# Altium schematic sheet CW341_FPGAIO_1.SchDoc: Kintex IO Banks
size Letter; Organization: NewAE Technology Inc.; Address1: 1083 Queen St., Suite 196; Address2: Halifax; Address3: NS; Address4: Canada B3H 0B2; DocumentNumber: .; Revision: .; SheetNumber: 6; SheetTotal: 16; SheetApproved: YES
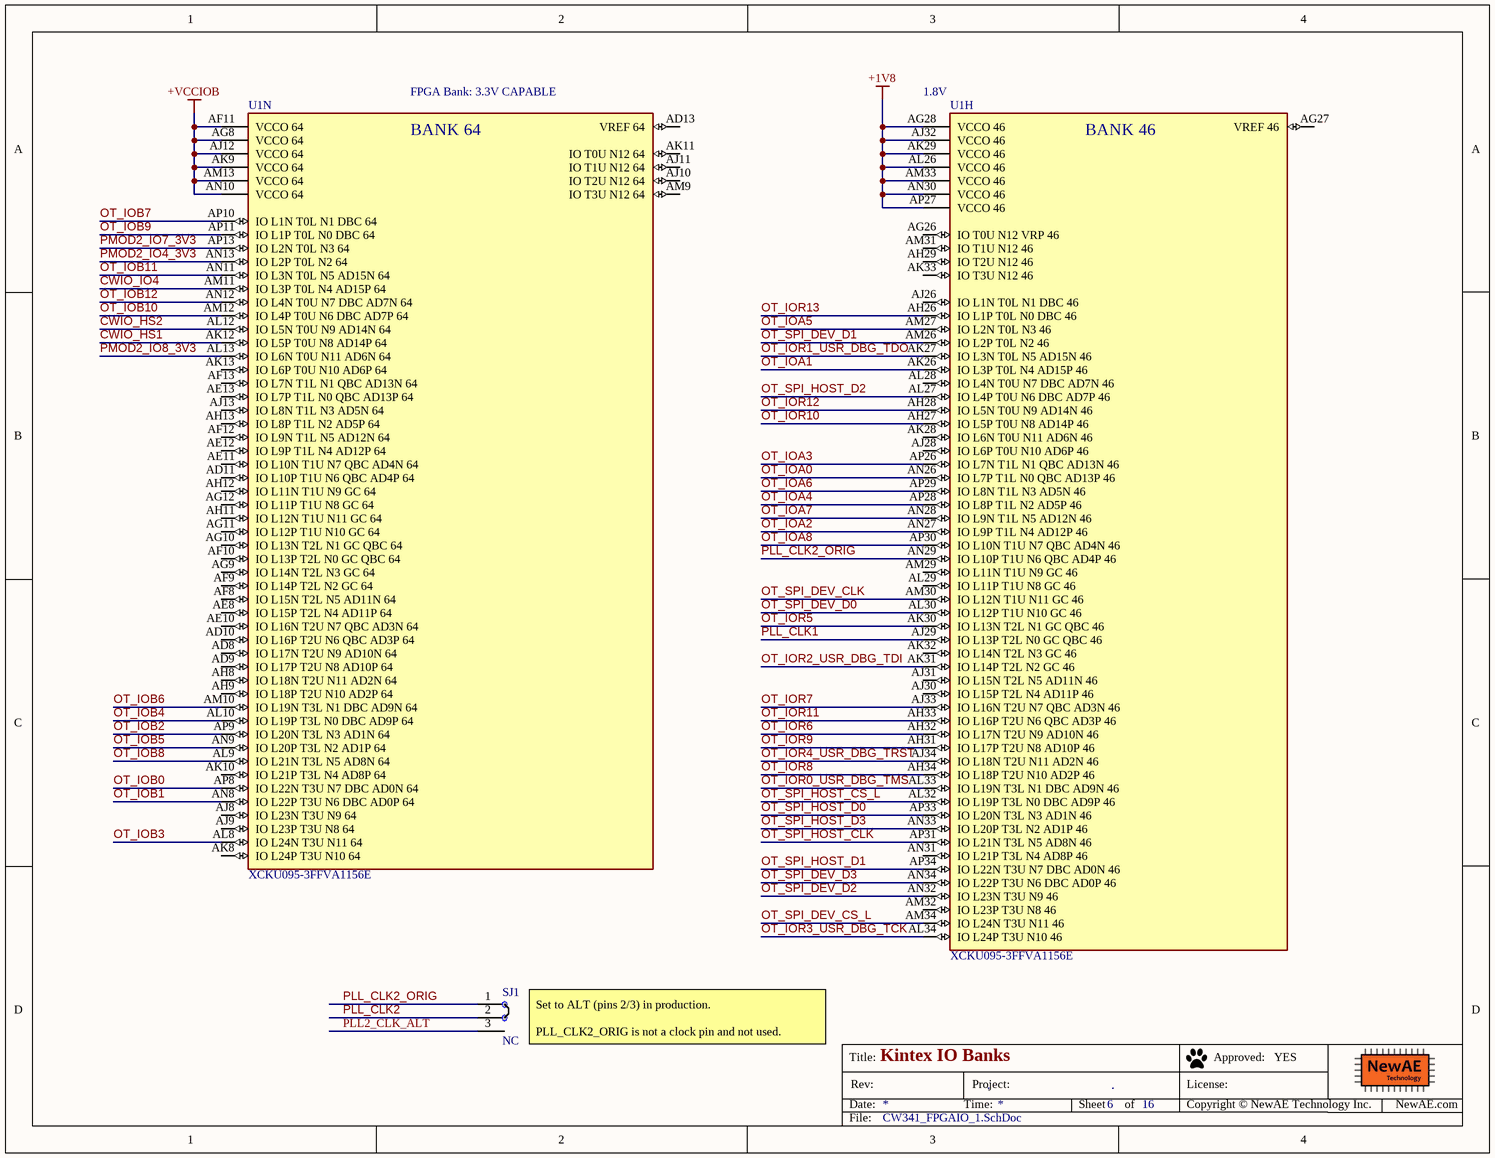
[diagram p0: CW341_FPGAIO_1.SchDoc]

## Parts
SJ1  NC  [SJ_3S_NC12]  (no BOM)
U1  XCKU095-3FFVA1156E  [FP-XCKU060-3FFVA1156E-MFG]  (parts H,N of 23)

## Nets
+1V8: U1.AG28(VCCO_46) U1.AJ32(VCCO_46) U1.AK29(VCCO_46) U1.AL26(VCCO_46) U1.AM33(VCCO_46) U1.AN30(VCCO_46) U1.AP27(VCCO_46)
+VCCIOB: U1.AF11(VCCO_64) U1.AG8(VCCO_64) U1.AJ12(VCCO_64) U1.AK9(VCCO_64) U1.AM13(VCCO_64) U1.AN10(VCCO_64)
CWIO_HS1: U1.AK12(IO_L5P_T0U_N8_AD14P_64)
CWIO_HS2: U1.AL12(IO_L5N_T0U_N9_AD14N_64)
CWIO_IO4: U1.AM11(IO_L3P_T0L_N4_AD15P_64)
OT_IOA0: U1.AN26(IO_L7P_T1L_N0_QBC_AD13P_46)
OT_IOA1: U1.AK26(IO_L3P_T0L_N4_AD15P_46)
OT_IOA2: U1.AN27(IO_L9P_T1L_N4_AD12P_46)
OT_IOA3: U1.AP26(IO_L7N_T1L_N1_QBC_AD13N_46)
OT_IOA4: U1.AP28(IO_L8P_T1L_N2_AD5P_46)
OT_IOA5: U1.AM27(IO_L2N_T0L_N3_46)
OT_IOA6: U1.AP29(IO_L8N_T1L_N3_AD5N_46)
OT_IOA7: U1.AN28(IO_L9N_T1L_N5_AD12N_46)
OT_IOA8: U1.AP30(IO_L10N_T1U_N7_QBC_AD4N_46)
OT_IOB0: U1.AP8(IO_L22N_T3U_N7_DBC_AD0N_64)
OT_IOB1: U1.AN8(IO_L22P_T3U_N6_DBC_AD0P_64)
OT_IOB2: U1.AP9(IO_L20N_T3L_N3_AD1N_64)
OT_IOB3: U1.AL8(IO_L24N_T3U_N11_64)
OT_IOB4: U1.AL10(IO_L19P_T3L_N0_DBC_AD9P_64)
OT_IOB5: U1.AN9(IO_L20P_T3L_N2_AD1P_64)
OT_IOB6: U1.AM10(IO_L19N_T3L_N1_DBC_AD9N_64)
OT_IOB7: U1.AP10(IO_L1N_T0L_N1_DBC_64)
OT_IOB8: U1.AL9(IO_L21N_T3L_N5_AD8N_64)
OT_IOB9: U1.AP11(IO_L1P_T0L_N0_DBC_64)
OT_IOB10: U1.AM12(IO_L4P_T0U_N6_DBC_AD7P_64)
OT_IOB11: U1.AN11(IO_L3N_T0L_N5_AD15N_64)
OT_IOB12: U1.AN12(IO_L4N_T0U_N7_DBC_AD7N_64)
OT_IOR0_USR_DBG_TMS: U1.AL33(IO_L19N_T3L_N1_DBC_AD9N_46)
OT_IOR1_USR_DBG_TDO: U1.AK27(IO_L3N_T0L_N5_AD15N_46)
OT_IOR2_USR_DBG_TDI: U1.AK31(IO_L14P_T2L_N2_GC_46)
OT_IOR3_USR_DBG_TCK: U1.AL34(IO_L24P_T3U_N10_46)
OT_IOR4_USR_DBG_TRST: U1.AJ34(IO_L18N_T2U_N11_AD2N_46)
OT_IOR5: U1.AK30(IO_L13N_T2L_N1_GC_QBC_46)
OT_IOR6: U1.AH32(IO_L17N_T2U_N9_AD10N_46)
OT_IOR7: U1.AJ33(IO_L16N_T2U_N7_QBC_AD3N_46)
OT_IOR8: U1.AH34(IO_L18P_T2U_N10_AD2P_46)
OT_IOR9: U1.AH31(IO_L17P_T2U_N8_AD10P_46)
OT_IOR10: U1.AH27(IO_L5P_T0U_N8_AD14P_46)
OT_IOR11: U1.AH33(IO_L16P_T2U_N6_QBC_AD3P_46)
OT_IOR12: U1.AH28(IO_L5N_T0U_N9_AD14N_46)
OT_IOR13: U1.AH26(IO_L1P_T0L_N0_DBC_46)
OT_SPI_DEV_CLK: U1.AM30(IO_L12N_T1U_N11_GC_46)
OT_SPI_DEV_CS_L: U1.AM34(IO_L24N_T3U_N11_46)
OT_SPI_DEV_D0: U1.AL30(IO_L12P_T1U_N10_GC_46)
OT_SPI_DEV_D1: U1.AM26(IO_L2P_T0L_N2_46)
OT_SPI_DEV_D2: U1.AN32(IO_L23N_T3U_N9_46)
OT_SPI_DEV_D3: U1.AN34(IO_L22P_T3U_N6_DBC_AD0P_46)
OT_SPI_HOST_CLK: U1.AP31(IO_L21N_T3L_N5_AD8N_46)
OT_SPI_HOST_CS_L: U1.AL32(IO_L19P_T3L_N0_DBC_AD9P_46)
OT_SPI_HOST_D0: U1.AP33(IO_L20N_T3L_N3_AD1N_46)
OT_SPI_HOST_D1: U1.AP34(IO_L22N_T3U_N7_DBC_AD0N_46)
OT_SPI_HOST_D2: U1.AL27(IO_L4P_T0U_N6_DBC_AD7P_46)
OT_SPI_HOST_D3: U1.AN33(IO_L20P_T3L_N2_AD1P_46)
PLL2_CLK_ALT: SJ1.3
PLL_CLK1: U1.AJ29(IO_L13P_T2L_N0_GC_QBC_46)
PLL_CLK2: SJ1.2
PLL_CLK2_ORIG: SJ1.1 U1.AN29(IO_L10P_T1U_N6_QBC_AD4P_46)
PMOD2_IO4_3V3: U1.AN13(IO_L2P_T0L_N2_64)
PMOD2_IO7_3V3: U1.AP13(IO_L2N_T0L_N3_64)
PMOD2_IO8_3V3: U1.AL13(IO_L6N_T0U_N11_AD6N_64)

Not connected (* = marked no-connect by the designer): U1 AD8(IO_L17N_T2U_N9_AD10N_64) AD9(IO_L17P_T2U_N8_AD10P_64) AD10(IO_L16P_T2U_N6_QBC_AD3P_64) AD11(IO_L10P_T1U_N6_QBC_AD4P_64) AD13(VREF_64) AE8(IO_L15P_T2L_N4_AD11P_64) AE10(IO_L16N_T2U_N7_QBC_AD3N_64) AE11(IO_L10N_T1U_N7_QBC_AD4N_64) AE12(IO_L9P_T1L_N4_AD12P_64) AE13(IO_L7P_T1L_N0_QBC_AD13P_64) AF8(IO_L15N_T2L_N5_AD11N_64) AF9(IO_L14P_T2L_N2_GC_64) AF10(IO_L13P_T2L_N0_GC_QBC_64) AF12(IO_L9N_T1L_N5_AD12N_64) AF13(IO_L7N_T1L_N1_QBC_AD13N_64) AG9(IO_L14N_T2L_N3_GC_64) AG10(IO_L13N_T2L_N1_GC_QBC_64) AG11(IO_L12P_T1U_N10_GC_64) AG12(IO_L11P_T1U_N8_GC_64) AG26(IO_T0U_N12_VRP_46) AG27(VREF_46) AH8(IO_L18N_T2U_N11_AD2N_64) AH9(IO_L18P_T2U_N10_AD2P_64) AH11(IO_L12N_T1U_N11_GC_64) AH12(IO_L11N_T1U_N9_GC_64) AH13(IO_L8P_T1L_N2_AD5P_64) AH29(IO_T2U_N12_46) AJ8(IO_L23N_T3U_N9_64) AJ9(IO_L23P_T3U_N8_64) AJ10(IO_T2U_N12_64) AJ11(IO_T1U_N12_64) AJ13(IO_L8N_T1L_N3_AD5N_64) AJ26(IO_L1N_T0L_N1_DBC_46) AJ28(IO_L6P_T0U_N10_AD6P_46) AJ30(IO_L15P_T2L_N4_AD11P_46) AJ31(IO_L15N_T2L_N5_AD11N_46) AK8(IO_L24P_T3U_N10_64) AK10(IO_L21P_T3L_N4_AD8P_64) AK11(IO_T0U_N12_64) AK13(IO_L6P_T0U_N10_AD6P_64) AK28(IO_L6N_T0U_N11_AD6N_46) AK32(IO_L14N_T2L_N3_GC_46) AK33(IO_T3U_N12_46) AL28(IO_L4N_T0U_N7_DBC_AD7N_46) AL29(IO_L11P_T1U_N8_GC_46) AM9(IO_T3U_N12_64) AM29(IO_L11N_T1U_N9_GC_46) AM31(IO_T1U_N12_46) AM32(IO_L23P_T3U_N8_46) AN31(IO_L21P_T3L_N4_AD8P_46)

## Notes on the sheet
- (near U1) FPGA Bank: 3.3V CAPABLE
- (near U1) 1.8V
- (near SJ1) Set to ALT (pins 2/3) in production.
  PLL_CLK2_ORIG is not a clock pin and not used.
- Title:
- Date:
- Rev:
- Time:
- Project:
- Sheet
- of
- License:
- Copyright © NewAE Technology Inc.
- Approved:
- NewAE.com
- File:
- (in symbol IC-XCKU095-1156, part H) BANK 46
- (in symbol IC-XCKU095-1156, part N) BANK 64

## Library data of the parts
SJ1 = SJ_3S_12JMP: Solder Jumper, NC; Component Group: PCB Feature; Part Number: SJ_3S_12JMP; Pin Count: 3; Mounting Technology: COPPER; Component Type: Standard (No BOM)
U1 = IC-XCKU095-1156: IC FPGA 520 I/O 1156FCBGA; Manufacturer: Xilinx; Manufacturer Part Number: XCKU060-3FFVA1156E; Standoff Height: 0.4mm; Ram Size: 38MBytes; Min Supply Voltage: 0.97V; Max Junction Temp: +100°C; Max Supply Voltage: 1.8V; Number Of Logic Elements Cells: 1176000; Number Of I/Os: 520; Speed Grade: 3; Memory Type: RAM; Ipc Land Pattern Name: BGA1156N100P34X34_3500X3500X342; RoHS: TRUE; Height: 3.51mm; Footprint Url: https://www.xilinx.com/support/documentation/user_guides/ug575-ultrascale-pkg-pinout.pdf; Device Class L2: Embedded Processors and Controllers; ComponentLink2URL: https://www.xilinx.com/support/documentation/data_sheets/ds890-ultrascale-overview.pdf; Temperature Range High: +100°C; Device Class L1: Integrated Circuits (ICs); Package: 0; Octopart: https://octopart.com/xcku035-3ffva1156e-xilinx-67038192?r=sp; Automotive: No; ComponentLink2Description: Datasheet; Device Class L3: FPGAs - Field Programmable Gate Arrays; Category: IC; Lead Free: Yes; Temperature: 0°C to +100°C; Temperature Range Low: 0°C; Digikey Description: IC FPGA 520 I/O 1156FCBGA